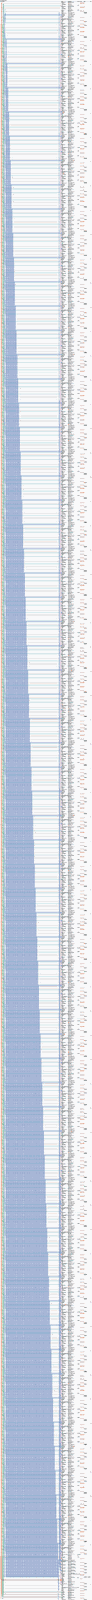
[diagram p0: system contents, whole]
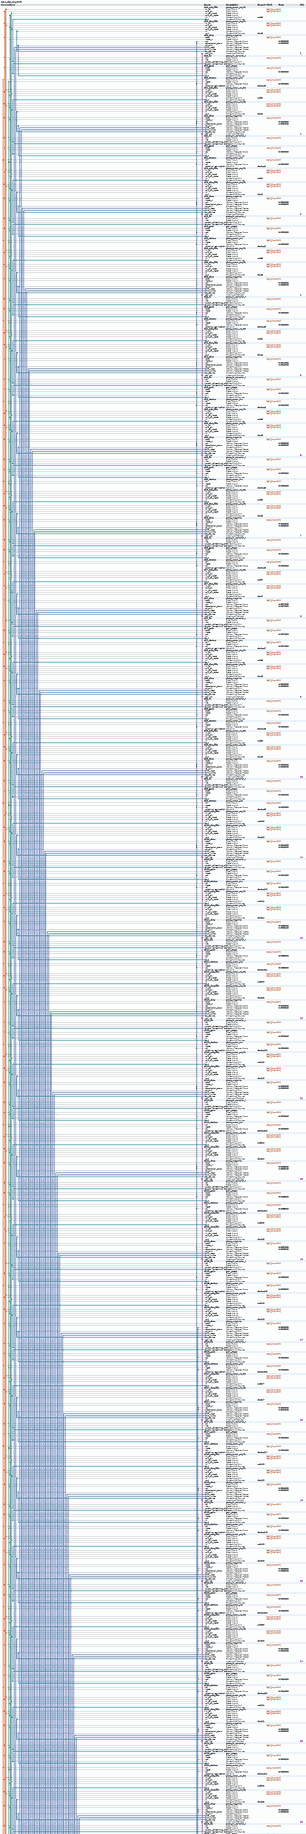
[diagram p1: system contents, upper part]
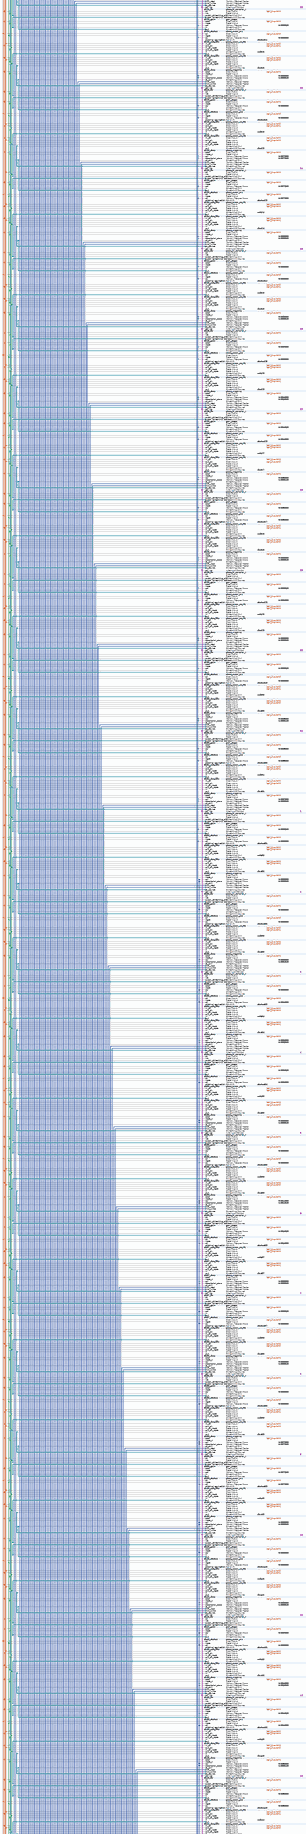
[diagram p2: system contents, middle part]
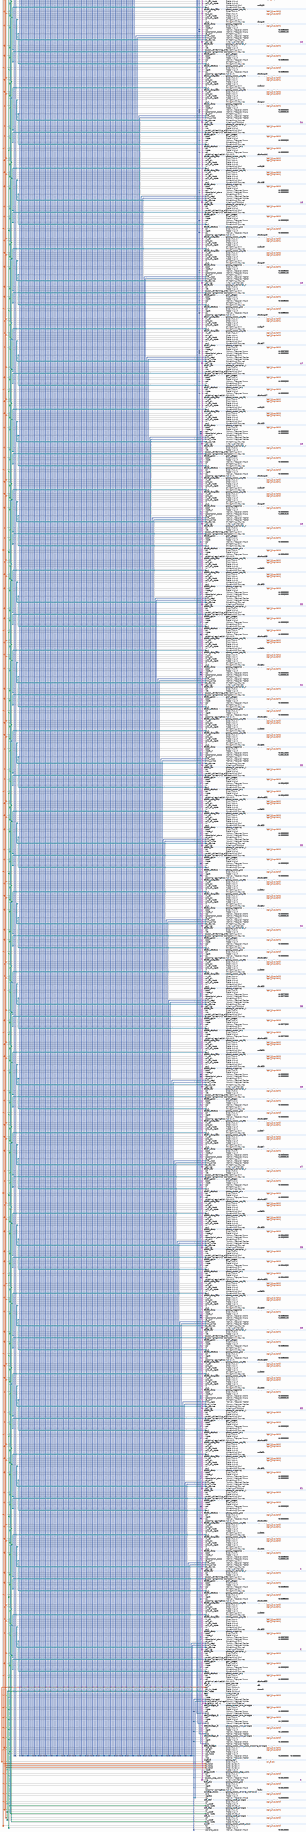
[diagram p3: system contents, lower part]
# Platform Designer (Qsys) system qsys_dsp_soc_64ch
# Parameters at their usual value, and those the tool derives, are not listed.
package require -exact qsys 23.1
create_system qsys_dsp_soc_64ch
set_project_property DEVICE_FAMILY {Agilex 7}

add_instance ch0_adc_fifo altera_avalon_dc_fifo 23.1
set_instance_parameter_value ch0_adc_fifo FIFO_DEPTH 512

add_instance ch0_dac_fifo altera_avalon_dc_fifo 23.1
set_instance_parameter_value ch0_dac_fifo FIFO_DEPTH 512

add_instance ch0_dma altera_msgdma 23.1
set_instance_parameter_value ch0_dma MODE 0
set_instance_parameter_value ch0_dma DATA_WIDTH 32

add_instance ch0_fir altera_fir_compiler_ii 23.1
set_instance_parameter_value ch0_fir inputBitWidth 16

add_instance ch0_gain gain_stage 1.0
set_instance_parameter_value ch0_gain GAIN_WIDTH 12

add_instance ch0_status altera_avalon_pio 23.1
set_instance_parameter_value ch0_status direction Input
set_instance_parameter_value ch0_status width 8

add_instance ch1_adc_fifo altera_avalon_dc_fifo 23.1
set_instance_parameter_value ch1_adc_fifo FIFO_DEPTH 512

add_instance ch1_dac_fifo altera_avalon_dc_fifo 23.1
set_instance_parameter_value ch1_dac_fifo FIFO_DEPTH 512

add_instance ch1_dma altera_msgdma 23.1
set_instance_parameter_value ch1_dma MODE 0
set_instance_parameter_value ch1_dma DATA_WIDTH 32

add_instance ch1_fir altera_fir_compiler_ii 23.1
set_instance_parameter_value ch1_fir inputBitWidth 16

add_instance ch1_gain gain_stage 1.0
set_instance_parameter_value ch1_gain GAIN_WIDTH 12

add_instance ch1_status altera_avalon_pio 23.1
set_instance_parameter_value ch1_status direction Input
set_instance_parameter_value ch1_status width 8

add_instance ch2_adc_fifo altera_avalon_dc_fifo 23.1
set_instance_parameter_value ch2_adc_fifo FIFO_DEPTH 512

add_instance ch2_dac_fifo altera_avalon_dc_fifo 23.1
set_instance_parameter_value ch2_dac_fifo FIFO_DEPTH 512

add_instance ch2_dma altera_msgdma 23.1
set_instance_parameter_value ch2_dma MODE 0
set_instance_parameter_value ch2_dma DATA_WIDTH 32

add_instance ch2_fir altera_fir_compiler_ii 23.1
set_instance_parameter_value ch2_fir inputBitWidth 16

add_instance ch2_gain gain_stage 1.0
set_instance_parameter_value ch2_gain GAIN_WIDTH 12

add_instance ch2_status altera_avalon_pio 23.1
set_instance_parameter_value ch2_status direction Input
set_instance_parameter_value ch2_status width 8

add_instance ch3_adc_fifo altera_avalon_dc_fifo 23.1
set_instance_parameter_value ch3_adc_fifo FIFO_DEPTH 512

add_instance ch3_dac_fifo altera_avalon_dc_fifo 23.1
set_instance_parameter_value ch3_dac_fifo FIFO_DEPTH 512

add_instance ch3_dma altera_msgdma 23.1
set_instance_parameter_value ch3_dma MODE 0
set_instance_parameter_value ch3_dma DATA_WIDTH 32

add_instance ch3_fir altera_fir_compiler_ii 23.1
set_instance_parameter_value ch3_fir inputBitWidth 16

add_instance ch3_gain gain_stage 1.0
set_instance_parameter_value ch3_gain GAIN_WIDTH 12

add_instance ch3_status altera_avalon_pio 23.1
set_instance_parameter_value ch3_status direction Input
set_instance_parameter_value ch3_status width 8

add_instance ch4_adc_fifo altera_avalon_dc_fifo 23.1
set_instance_parameter_value ch4_adc_fifo FIFO_DEPTH 512

add_instance ch4_dac_fifo altera_avalon_dc_fifo 23.1
set_instance_parameter_value ch4_dac_fifo FIFO_DEPTH 512

add_instance ch4_dma altera_msgdma 23.1
set_instance_parameter_value ch4_dma MODE 0
set_instance_parameter_value ch4_dma DATA_WIDTH 32

add_instance ch4_fir altera_fir_compiler_ii 23.1
set_instance_parameter_value ch4_fir inputBitWidth 16

add_instance ch4_gain gain_stage 1.0
set_instance_parameter_value ch4_gain GAIN_WIDTH 12

add_instance ch4_status altera_avalon_pio 23.1
set_instance_parameter_value ch4_status direction Input
set_instance_parameter_value ch4_status width 8

add_instance ch5_adc_fifo altera_avalon_dc_fifo 23.1
set_instance_parameter_value ch5_adc_fifo FIFO_DEPTH 512

add_instance ch5_dac_fifo altera_avalon_dc_fifo 23.1
set_instance_parameter_value ch5_dac_fifo FIFO_DEPTH 512

add_instance ch5_dma altera_msgdma 23.1
set_instance_parameter_value ch5_dma MODE 0
set_instance_parameter_value ch5_dma DATA_WIDTH 32

add_instance ch5_fir altera_fir_compiler_ii 23.1
set_instance_parameter_value ch5_fir inputBitWidth 16

add_instance ch5_gain gain_stage 1.0
set_instance_parameter_value ch5_gain GAIN_WIDTH 12

add_instance ch5_status altera_avalon_pio 23.1
set_instance_parameter_value ch5_status direction Input
set_instance_parameter_value ch5_status width 8

add_instance ch6_adc_fifo altera_avalon_dc_fifo 23.1
set_instance_parameter_value ch6_adc_fifo FIFO_DEPTH 512

add_instance ch6_dac_fifo altera_avalon_dc_fifo 23.1
set_instance_parameter_value ch6_dac_fifo FIFO_DEPTH 512

add_instance ch6_dma altera_msgdma 23.1
set_instance_parameter_value ch6_dma MODE 0
set_instance_parameter_value ch6_dma DATA_WIDTH 32

add_instance ch6_fir altera_fir_compiler_ii 23.1
set_instance_parameter_value ch6_fir inputBitWidth 16

add_instance ch6_gain gain_stage 1.0
set_instance_parameter_value ch6_gain GAIN_WIDTH 12

add_instance ch6_status altera_avalon_pio 23.1
set_instance_parameter_value ch6_status direction Input
set_instance_parameter_value ch6_status width 8

add_instance ch7_adc_fifo altera_avalon_dc_fifo 23.1
set_instance_parameter_value ch7_adc_fifo FIFO_DEPTH 512

add_instance ch7_dac_fifo altera_avalon_dc_fifo 23.1
set_instance_parameter_value ch7_dac_fifo FIFO_DEPTH 512

add_instance ch7_dma altera_msgdma 23.1
set_instance_parameter_value ch7_dma MODE 0
set_instance_parameter_value ch7_dma DATA_WIDTH 32

add_instance ch7_fir altera_fir_compiler_ii 23.1
set_instance_parameter_value ch7_fir inputBitWidth 16

add_instance ch7_gain gain_stage 1.0
set_instance_parameter_value ch7_gain GAIN_WIDTH 12

add_instance ch7_status altera_avalon_pio 23.1
set_instance_parameter_value ch7_status direction Input
set_instance_parameter_value ch7_status width 8

add_instance ch8_adc_fifo altera_avalon_dc_fifo 23.1
set_instance_parameter_value ch8_adc_fifo FIFO_DEPTH 512

add_instance ch8_dac_fifo altera_avalon_dc_fifo 23.1
set_instance_parameter_value ch8_dac_fifo FIFO_DEPTH 512

add_instance ch8_dma altera_msgdma 23.1
set_instance_parameter_value ch8_dma MODE 0
set_instance_parameter_value ch8_dma DATA_WIDTH 32

add_instance ch8_fir altera_fir_compiler_ii 23.1
set_instance_parameter_value ch8_fir inputBitWidth 16

add_instance ch8_gain gain_stage 1.0
set_instance_parameter_value ch8_gain GAIN_WIDTH 12

add_instance ch8_status altera_avalon_pio 23.1
set_instance_parameter_value ch8_status direction Input
set_instance_parameter_value ch8_status width 8

add_instance ch9_adc_fifo altera_avalon_dc_fifo 23.1
set_instance_parameter_value ch9_adc_fifo FIFO_DEPTH 512

add_instance ch9_dac_fifo altera_avalon_dc_fifo 23.1
set_instance_parameter_value ch9_dac_fifo FIFO_DEPTH 512

add_instance ch9_dma altera_msgdma 23.1
set_instance_parameter_value ch9_dma MODE 0
set_instance_parameter_value ch9_dma DATA_WIDTH 32

add_instance ch9_fir altera_fir_compiler_ii 23.1
set_instance_parameter_value ch9_fir inputBitWidth 16

add_instance ch9_gain gain_stage 1.0
set_instance_parameter_value ch9_gain GAIN_WIDTH 12

add_instance ch9_status altera_avalon_pio 23.1
set_instance_parameter_value ch9_status direction Input
set_instance_parameter_value ch9_status width 8

add_instance ch10_adc_fifo altera_avalon_dc_fifo 23.1
set_instance_parameter_value ch10_adc_fifo FIFO_DEPTH 512

add_instance ch10_dac_fifo altera_avalon_dc_fifo 23.1
set_instance_parameter_value ch10_dac_fifo FIFO_DEPTH 512

add_instance ch10_dma altera_msgdma 23.1
set_instance_parameter_value ch10_dma MODE 0
set_instance_parameter_value ch10_dma DATA_WIDTH 32

add_instance ch10_fir altera_fir_compiler_ii 23.1
set_instance_parameter_value ch10_fir inputBitWidth 16

add_instance ch10_gain gain_stage 1.0
set_instance_parameter_value ch10_gain GAIN_WIDTH 12

add_instance ch10_status altera_avalon_pio 23.1
set_instance_parameter_value ch10_status direction Input
set_instance_parameter_value ch10_status width 8

add_instance ch11_adc_fifo altera_avalon_dc_fifo 23.1
set_instance_parameter_value ch11_adc_fifo FIFO_DEPTH 512

add_instance ch11_dac_fifo altera_avalon_dc_fifo 23.1
set_instance_parameter_value ch11_dac_fifo FIFO_DEPTH 512

add_instance ch11_dma altera_msgdma 23.1
set_instance_parameter_value ch11_dma MODE 0
set_instance_parameter_value ch11_dma DATA_WIDTH 32

add_instance ch11_fir altera_fir_compiler_ii 23.1
set_instance_parameter_value ch11_fir inputBitWidth 16

add_instance ch11_gain gain_stage 1.0
set_instance_parameter_value ch11_gain GAIN_WIDTH 12

add_instance ch11_status altera_avalon_pio 23.1
set_instance_parameter_value ch11_status direction Input
set_instance_parameter_value ch11_status width 8

add_instance ch12_adc_fifo altera_avalon_dc_fifo 23.1
set_instance_parameter_value ch12_adc_fifo FIFO_DEPTH 512

add_instance ch12_dac_fifo altera_avalon_dc_fifo 23.1
set_instance_parameter_value ch12_dac_fifo FIFO_DEPTH 512

add_instance ch12_dma altera_msgdma 23.1
set_instance_parameter_value ch12_dma MODE 0
set_instance_parameter_value ch12_dma DATA_WIDTH 32

add_instance ch12_fir altera_fir_compiler_ii 23.1
set_instance_parameter_value ch12_fir inputBitWidth 16

add_instance ch12_gain gain_stage 1.0
set_instance_parameter_value ch12_gain GAIN_WIDTH 12

add_instance ch12_status altera_avalon_pio 23.1
set_instance_parameter_value ch12_status direction Input
set_instance_parameter_value ch12_status width 8

add_instance ch13_adc_fifo altera_avalon_dc_fifo 23.1
set_instance_parameter_value ch13_adc_fifo FIFO_DEPTH 512

add_instance ch13_dac_fifo altera_avalon_dc_fifo 23.1
set_instance_parameter_value ch13_dac_fifo FIFO_DEPTH 512

add_instance ch13_dma altera_msgdma 23.1
set_instance_parameter_value ch13_dma MODE 0
set_instance_parameter_value ch13_dma DATA_WIDTH 32

add_instance ch13_fir altera_fir_compiler_ii 23.1
set_instance_parameter_value ch13_fir inputBitWidth 16

add_instance ch13_gain gain_stage 1.0
set_instance_parameter_value ch13_gain GAIN_WIDTH 12

add_instance ch13_status altera_avalon_pio 23.1
set_instance_parameter_value ch13_status direction Input
set_instance_parameter_value ch13_status width 8

add_instance ch14_adc_fifo altera_avalon_dc_fifo 23.1
set_instance_parameter_value ch14_adc_fifo FIFO_DEPTH 512

add_instance ch14_dac_fifo altera_avalon_dc_fifo 23.1
set_instance_parameter_value ch14_dac_fifo FIFO_DEPTH 512

add_instance ch14_dma altera_msgdma 23.1
set_instance_parameter_value ch14_dma MODE 0
set_instance_parameter_value ch14_dma DATA_WIDTH 32

add_instance ch14_fir altera_fir_compiler_ii 23.1
set_instance_parameter_value ch14_fir inputBitWidth 16

add_instance ch14_gain gain_stage 1.0
set_instance_parameter_value ch14_gain GAIN_WIDTH 12

add_instance ch14_status altera_avalon_pio 23.1
set_instance_parameter_value ch14_status direction Input
set_instance_parameter_value ch14_status width 8

add_instance ch15_adc_fifo altera_avalon_dc_fifo 23.1
set_instance_parameter_value ch15_adc_fifo FIFO_DEPTH 512

add_instance ch15_dac_fifo altera_avalon_dc_fifo 23.1
set_instance_parameter_value ch15_dac_fifo FIFO_DEPTH 512

add_instance ch15_dma altera_msgdma 23.1
set_instance_parameter_value ch15_dma MODE 0
set_instance_parameter_value ch15_dma DATA_WIDTH 32

add_instance ch15_fir altera_fir_compiler_ii 23.1
set_instance_parameter_value ch15_fir inputBitWidth 16

add_instance ch15_gain gain_stage 1.0
set_instance_parameter_value ch15_gain GAIN_WIDTH 12

add_instance ch15_status altera_avalon_pio 23.1
set_instance_parameter_value ch15_status direction Input
set_instance_parameter_value ch15_status width 8

add_instance ch16_adc_fifo altera_avalon_dc_fifo 23.1
set_instance_parameter_value ch16_adc_fifo FIFO_DEPTH 512

add_instance ch16_dac_fifo altera_avalon_dc_fifo 23.1
set_instance_parameter_value ch16_dac_fifo FIFO_DEPTH 512

add_instance ch16_dma altera_msgdma 23.1
set_instance_parameter_value ch16_dma MODE 0
set_instance_parameter_value ch16_dma DATA_WIDTH 32

add_instance ch16_fir altera_fir_compiler_ii 23.1
set_instance_parameter_value ch16_fir inputBitWidth 16

add_instance ch16_gain gain_stage 1.0
set_instance_parameter_value ch16_gain GAIN_WIDTH 12

add_instance ch16_status altera_avalon_pio 23.1
set_instance_parameter_value ch16_status direction Input
set_instance_parameter_value ch16_status width 8

add_instance ch17_adc_fifo altera_avalon_dc_fifo 23.1
set_instance_parameter_value ch17_adc_fifo FIFO_DEPTH 512

add_instance ch17_dac_fifo altera_avalon_dc_fifo 23.1
set_instance_parameter_value ch17_dac_fifo FIFO_DEPTH 512

add_instance ch17_dma altera_msgdma 23.1
set_instance_parameter_value ch17_dma MODE 0
set_instance_parameter_value ch17_dma DATA_WIDTH 32

add_instance ch17_fir altera_fir_compiler_ii 23.1
set_instance_parameter_value ch17_fir inputBitWidth 16

add_instance ch17_gain gain_stage 1.0
set_instance_parameter_value ch17_gain GAIN_WIDTH 12

add_instance ch17_status altera_avalon_pio 23.1
set_instance_parameter_value ch17_status direction Input
set_instance_parameter_value ch17_status width 8

add_instance ch18_adc_fifo altera_avalon_dc_fifo 23.1
set_instance_parameter_value ch18_adc_fifo FIFO_DEPTH 512

add_instance ch18_dac_fifo altera_avalon_dc_fifo 23.1
set_instance_parameter_value ch18_dac_fifo FIFO_DEPTH 512

add_instance ch18_dma altera_msgdma 23.1
set_instance_parameter_value ch18_dma MODE 0
set_instance_parameter_value ch18_dma DATA_WIDTH 32

add_instance ch18_fir altera_fir_compiler_ii 23.1
set_instance_parameter_value ch18_fir inputBitWidth 16

add_instance ch18_gain gain_stage 1.0
set_instance_parameter_value ch18_gain GAIN_WIDTH 12

add_instance ch18_status altera_avalon_pio 23.1
set_instance_parameter_value ch18_status direction Input
set_instance_parameter_value ch18_status width 8

add_instance ch19_adc_fifo altera_avalon_dc_fifo 23.1
set_instance_parameter_value ch19_adc_fifo FIFO_DEPTH 512

add_instance ch19_dac_fifo altera_avalon_dc_fifo 23.1
set_instance_parameter_value ch19_dac_fifo FIFO_DEPTH 512

add_instance ch19_dma altera_msgdma 23.1
set_instance_parameter_value ch19_dma MODE 0
set_instance_parameter_value ch19_dma DATA_WIDTH 32

add_instance ch19_fir altera_fir_compiler_ii 23.1
set_instance_parameter_value ch19_fir inputBitWidth 16

add_instance ch19_gain gain_stage 1.0
set_instance_parameter_value ch19_gain GAIN_WIDTH 12

add_instance ch19_status altera_avalon_pio 23.1
set_instance_parameter_value ch19_status direction Input
set_instance_parameter_value ch19_status width 8

add_instance ch20_adc_fifo altera_avalon_dc_fifo 23.1
set_instance_parameter_value ch20_adc_fifo FIFO_DEPTH 512

add_instance ch20_dac_fifo altera_avalon_dc_fifo 23.1
set_instance_parameter_value ch20_dac_fifo FIFO_DEPTH 512

add_instance ch20_dma altera_msgdma 23.1
set_instance_parameter_value ch20_dma MODE 0
set_instance_parameter_value ch20_dma DATA_WIDTH 32

add_instance ch20_fir altera_fir_compiler_ii 23.1
set_instance_parameter_value ch20_fir inputBitWidth 16

add_instance ch20_gain gain_stage 1.0
set_instance_parameter_value ch20_gain GAIN_WIDTH 12

add_instance ch20_status altera_avalon_pio 23.1
set_instance_parameter_value ch20_status direction Input
set_instance_parameter_value ch20_status width 8

add_instance ch21_adc_fifo altera_avalon_dc_fifo 23.1
set_instance_parameter_value ch21_adc_fifo FIFO_DEPTH 512

add_instance ch21_dac_fifo altera_avalon_dc_fifo 23.1
set_instance_parameter_value ch21_dac_fifo FIFO_DEPTH 512

add_instance ch21_dma altera_msgdma 23.1
set_instance_parameter_value ch21_dma MODE 0
set_instance_parameter_value ch21_dma DATA_WIDTH 32

add_instance ch21_fir altera_fir_compiler_ii 23.1
set_instance_parameter_value ch21_fir inputBitWidth 16

add_instance ch21_gain gain_stage 1.0
set_instance_parameter_value ch21_gain GAIN_WIDTH 12

add_instance ch21_status altera_avalon_pio 23.1
set_instance_parameter_value ch21_status direction Input
set_instance_parameter_value ch21_status width 8

add_instance ch22_adc_fifo altera_avalon_dc_fifo 23.1
set_instance_parameter_value ch22_adc_fifo FIFO_DEPTH 512

add_instance ch22_dac_fifo altera_avalon_dc_fifo 23.1
set_instance_parameter_value ch22_dac_fifo FIFO_DEPTH 512

add_instance ch22_dma altera_msgdma 23.1
set_instance_parameter_value ch22_dma MODE 0
set_instance_parameter_value ch22_dma DATA_WIDTH 32

add_instance ch22_fir altera_fir_compiler_ii 23.1
set_instance_parameter_value ch22_fir inputBitWidth 16

add_instance ch22_gain gain_stage 1.0
set_instance_parameter_value ch22_gain GAIN_WIDTH 12

add_instance ch22_status altera_avalon_pio 23.1
set_instance_parameter_value ch22_status direction Input
set_instance_parameter_value ch22_status width 8

add_instance ch23_adc_fifo altera_avalon_dc_fifo 23.1
set_instance_parameter_value ch23_adc_fifo FIFO_DEPTH 512

add_instance ch23_dac_fifo altera_avalon_dc_fifo 23.1
set_instance_parameter_value ch23_dac_fifo FIFO_DEPTH 512

add_instance ch23_dma altera_msgdma 23.1
set_instance_parameter_value ch23_dma MODE 0
set_instance_parameter_value ch23_dma DATA_WIDTH 32

add_instance ch23_fir altera_fir_compiler_ii 23.1
set_instance_parameter_value ch23_fir inputBitWidth 16

add_instance ch23_gain gain_stage 1.0
set_instance_parameter_value ch23_gain GAIN_WIDTH 12

add_instance ch23_status altera_avalon_pio 23.1
set_instance_parameter_value ch23_status direction Input
set_instance_parameter_value ch23_status width 8

add_instance ch24_adc_fifo altera_avalon_dc_fifo 23.1
set_instance_parameter_value ch24_adc_fifo FIFO_DEPTH 512

add_instance ch24_dac_fifo altera_avalon_dc_fifo 23.1
set_instance_parameter_value ch24_dac_fifo FIFO_DEPTH 512

add_instance ch24_dma altera_msgdma 23.1
set_instance_parameter_value ch24_dma MODE 0
set_instance_parameter_value ch24_dma DATA_WIDTH 32

add_instance ch24_fir altera_fir_compiler_ii 23.1
set_instance_parameter_value ch24_fir inputBitWidth 16

add_instance ch24_gain gain_stage 1.0
set_instance_parameter_value ch24_gain GAIN_WIDTH 12

add_instance ch24_status altera_avalon_pio 23.1
set_instance_parameter_value ch24_status direction Input
set_instance_parameter_value ch24_status width 8

add_instance ch25_adc_fifo altera_avalon_dc_fifo 23.1
set_instance_parameter_value ch25_adc_fifo FIFO_DEPTH 512

add_instance ch25_dac_fifo altera_avalon_dc_fifo 23.1
set_instance_parameter_value ch25_dac_fifo FIFO_DEPTH 512

add_instance ch25_dma altera_msgdma 23.1
set_instance_parameter_value ch25_dma MODE 0
set_instance_parameter_value ch25_dma DATA_WIDTH 32

add_instance ch25_fir altera_fir_compiler_ii 23.1
set_instance_parameter_value ch25_fir inputBitWidth 16

add_instance ch25_gain gain_stage 1.0
set_instance_parameter_value ch25_gain GAIN_WIDTH 12

add_instance ch25_status altera_avalon_pio 23.1
set_instance_parameter_value ch25_status direction Input
set_instance_parameter_value ch25_status width 8

add_instance ch26_adc_fifo altera_avalon_dc_fifo 23.1
set_instance_parameter_value ch26_adc_fifo FIFO_DEPTH 512

add_instance ch26_dac_fifo altera_avalon_dc_fifo 23.1
set_instance_parameter_value ch26_dac_fifo FIFO_DEPTH 512

add_instance ch26_dma altera_msgdma 23.1
set_instance_parameter_value ch26_dma MODE 0
set_instance_parameter_value ch26_dma DATA_WIDTH 32

add_instance ch26_fir altera_fir_compiler_ii 23.1
set_instance_parameter_value ch26_fir inputBitWidth 16

add_instance ch26_gain gain_stage 1.0
set_instance_parameter_value ch26_gain GAIN_WIDTH 12

add_instance ch26_status altera_avalon_pio 23.1
set_instance_parameter_value ch26_status direction Input
set_instance_parameter_value ch26_status width 8

add_instance ch27_adc_fifo altera_avalon_dc_fifo 23.1
set_instance_parameter_value ch27_adc_fifo FIFO_DEPTH 512

add_instance ch27_dac_fifo altera_avalon_dc_fifo 23.1
set_instance_parameter_value ch27_dac_fifo FIFO_DEPTH 512

add_instance ch27_dma altera_msgdma 23.1
set_instance_parameter_value ch27_dma MODE 0
set_instance_parameter_value ch27_dma DATA_WIDTH 32

add_instance ch27_fir altera_fir_compiler_ii 23.1
set_instance_parameter_value ch27_fir inputBitWidth 16

add_instance ch27_gain gain_stage 1.0
set_instance_parameter_value ch27_gain GAIN_WIDTH 12

add_instance ch27_status altera_avalon_pio 23.1
set_instance_parameter_value ch27_status direction Input
set_instance_parameter_value ch27_status width 8

add_instance ch28_adc_fifo altera_avalon_dc_fifo 23.1
set_instance_parameter_value ch28_adc_fifo FIFO_DEPTH 512

add_instance ch28_dac_fifo altera_avalon_dc_fifo 23.1
set_instance_parameter_value ch28_dac_fifo FIFO_DEPTH 512

add_instance ch28_dma altera_msgdma 23.1
set_instance_parameter_value ch28_dma MODE 0
set_instance_parameter_value ch28_dma DATA_WIDTH 32

add_instance ch28_fir altera_fir_compiler_ii 23.1
set_instance_parameter_value ch28_fir inputBitWidth 16

add_instance ch28_gain gain_stage 1.0
set_instance_parameter_value ch28_gain GAIN_WIDTH 12

add_instance ch28_status altera_avalon_pio 23.1
set_instance_parameter_value ch28_status direction Input
set_instance_parameter_value ch28_status width 8

add_instance ch29_adc_fifo altera_avalon_dc_fifo 23.1
set_instance_parameter_value ch29_adc_fifo FIFO_DEPTH 512

add_instance ch29_dac_fifo altera_avalon_dc_fifo 23.1
set_instance_parameter_value ch29_dac_fifo FIFO_DEPTH 512

add_instance ch29_dma altera_msgdma 23.1
set_instance_parameter_value ch29_dma MODE 0
set_instance_parameter_value ch29_dma DATA_WIDTH 32

add_instance ch29_fir altera_fir_compiler_ii 23.1
set_instance_parameter_value ch29_fir inputBitWidth 16

add_instance ch29_gain gain_stage 1.0
set_instance_parameter_value ch29_gain GAIN_WIDTH 12

add_instance ch29_status altera_avalon_pio 23.1
set_instance_parameter_value ch29_status direction Input
set_instance_parameter_value ch29_status width 8

add_instance ch30_adc_fifo altera_avalon_dc_fifo 23.1
set_instance_parameter_value ch30_adc_fifo FIFO_DEPTH 512

add_instance ch30_dac_fifo altera_avalon_dc_fifo 23.1
set_instance_parameter_value ch30_dac_fifo FIFO_DEPTH 512

add_instance ch30_dma altera_msgdma 23.1
set_instance_parameter_value ch30_dma MODE 0
set_instance_parameter_value ch30_dma DATA_WIDTH 32

add_instance ch30_fir altera_fir_compiler_ii 23.1
set_instance_parameter_value ch30_fir inputBitWidth 16

add_instance ch30_gain gain_stage 1.0
set_instance_parameter_value ch30_gain GAIN_WIDTH 12

add_instance ch30_status altera_avalon_pio 23.1
set_instance_parameter_value ch30_status direction Input
set_instance_parameter_value ch30_status width 8

add_instance ch31_adc_fifo altera_avalon_dc_fifo 23.1
set_instance_parameter_value ch31_adc_fifo FIFO_DEPTH 512

add_instance ch31_dac_fifo altera_avalon_dc_fifo 23.1
set_instance_parameter_value ch31_dac_fifo FIFO_DEPTH 512

add_instance ch31_dma altera_msgdma 23.1
set_instance_parameter_value ch31_dma MODE 0
set_instance_parameter_value ch31_dma DATA_WIDTH 32

add_instance ch31_fir altera_fir_compiler_ii 23.1
set_instance_parameter_value ch31_fir inputBitWidth 16

add_instance ch31_gain gain_stage 1.0
set_instance_parameter_value ch31_gain GAIN_WIDTH 12

add_instance ch31_status altera_avalon_pio 23.1
set_instance_parameter_value ch31_status direction Input
set_instance_parameter_value ch31_status width 8

add_instance ch32_adc_fifo altera_avalon_dc_fifo 23.1
set_instance_parameter_value ch32_adc_fifo FIFO_DEPTH 512

add_instance ch32_dac_fifo altera_avalon_dc_fifo 23.1
set_instance_parameter_value ch32_dac_fifo FIFO_DEPTH 512

add_instance ch32_dma altera_msgdma 23.1
set_instance_parameter_value ch32_dma MODE 0
set_instance_parameter_value ch32_dma DATA_WIDTH 32

add_instance ch32_fir altera_fir_compiler_ii 23.1
set_instance_parameter_value ch32_fir inputBitWidth 16

add_instance ch32_gain gain_stage 1.0
set_instance_parameter_value ch32_gain GAIN_WIDTH 12

add_instance ch32_status altera_avalon_pio 23.1
set_instance_parameter_value ch32_status direction Input
set_instance_parameter_value ch32_status width 8

add_instance ch33_adc_fifo altera_avalon_dc_fifo 23.1
set_instance_parameter_value ch33_adc_fifo FIFO_DEPTH 512

add_instance ch33_dac_fifo altera_avalon_dc_fifo 23.1
set_instance_parameter_value ch33_dac_fifo FIFO_DEPTH 512

add_instance ch33_dma altera_msgdma 23.1
set_instance_parameter_value ch33_dma MODE 0
set_instance_parameter_value ch33_dma DATA_WIDTH 32

add_instance ch33_fir altera_fir_compiler_ii 23.1
set_instance_parameter_value ch33_fir inputBitWidth 16

add_instance ch33_gain gain_stage 1.0
set_instance_parameter_value ch33_gain GAIN_WIDTH 12

add_instance ch33_status altera_avalon_pio 23.1
set_instance_parameter_value ch33_status direction Input
set_instance_parameter_value ch33_status width 8

add_instance ch34_adc_fifo altera_avalon_dc_fifo 23.1
set_instance_parameter_value ch34_adc_fifo FIFO_DEPTH 512

add_instance ch34_dac_fifo altera_avalon_dc_fifo 23.1
set_instance_parameter_value ch34_dac_fifo FIFO_DEPTH 512

add_instance ch34_dma altera_msgdma 23.1
set_instance_parameter_value ch34_dma MODE 0
set_instance_parameter_value ch34_dma DATA_WIDTH 32

add_instance ch34_fir altera_fir_compiler_ii 23.1
set_instance_parameter_value ch34_fir inputBitWidth 16

add_instance ch34_gain gain_stage 1.0
set_instance_parameter_value ch34_gain GAIN_WIDTH 12

add_instance ch34_status altera_avalon_pio 23.1
set_instance_parameter_value ch34_status direction Input
set_instance_parameter_value ch34_status width 8

add_instance ch35_adc_fifo altera_avalon_dc_fifo 23.1
set_instance_parameter_value ch35_adc_fifo FIFO_DEPTH 512

add_instance ch35_dac_fifo altera_avalon_dc_fifo 23.1
set_instance_parameter_value ch35_dac_fifo FIFO_DEPTH 512

add_instance ch35_dma altera_msgdma 23.1
set_instance_parameter_value ch35_dma MODE 0
set_instance_parameter_value ch35_dma DATA_WIDTH 32

add_instance ch35_fir altera_fir_compiler_ii 23.1
set_instance_parameter_value ch35_fir inputBitWidth 16

add_instance ch35_gain gain_stage 1.0
set_instance_parameter_value ch35_gain GAIN_WIDTH 12

add_instance ch35_status altera_avalon_pio 23.1
set_instance_parameter_value ch35_status direction Input
set_instance_parameter_value ch35_status width 8

add_instance ch36_adc_fifo altera_avalon_dc_fifo 23.1
set_instance_parameter_value ch36_adc_fifo FIFO_DEPTH 512

add_instance ch36_dac_fifo altera_avalon_dc_fifo 23.1
set_instance_parameter_value ch36_dac_fifo FIFO_DEPTH 512

add_instance ch36_dma altera_msgdma 23.1
set_instance_parameter_value ch36_dma MODE 0
set_instance_parameter_value ch36_dma DATA_WIDTH 32

add_instance ch36_fir altera_fir_compiler_ii 23.1
set_instance_parameter_value ch36_fir inputBitWidth 16

add_instance ch36_gain gain_stage 1.0
set_instance_parameter_value ch36_gain GAIN_WIDTH 12

add_instance ch36_status altera_avalon_pio 23.1
set_instance_parameter_value ch36_status direction Input
set_instance_parameter_value ch36_status width 8

add_instance ch37_adc_fifo altera_avalon_dc_fifo 23.1
set_instance_parameter_value ch37_adc_fifo FIFO_DEPTH 512

add_instance ch37_dac_fifo altera_avalon_dc_fifo 23.1
set_instance_parameter_value ch37_dac_fifo FIFO_DEPTH 512

add_instance ch37_dma altera_msgdma 23.1
set_instance_parameter_value ch37_dma MODE 0
set_instance_parameter_value ch37_dma DATA_WIDTH 32

add_instance ch37_fir altera_fir_compiler_ii 23.1
set_instance_parameter_value ch37_fir inputBitWidth 16

add_instance ch37_gain gain_stage 1.0
set_instance_parameter_value ch37_gain GAIN_WIDTH 12

add_instance ch37_status altera_avalon_pio 23.1
set_instance_parameter_value ch37_status direction Input
set_instance_parameter_value ch37_status width 8

add_instance ch38_adc_fifo altera_avalon_dc_fifo 23.1
set_instance_parameter_value ch38_adc_fifo FIFO_DEPTH 512

add_instance ch38_dac_fifo altera_avalon_dc_fifo 23.1
set_instance_parameter_value ch38_dac_fifo FIFO_DEPTH 512

add_instance ch38_dma altera_msgdma 23.1
set_instance_parameter_value ch38_dma MODE 0
set_instance_parameter_value ch38_dma DATA_WIDTH 32

add_instance ch38_fir altera_fir_compiler_ii 23.1
set_instance_parameter_value ch38_fir inputBitWidth 16

add_instance ch38_gain gain_stage 1.0
set_instance_parameter_value ch38_gain GAIN_WIDTH 12

add_instance ch38_status altera_avalon_pio 23.1
set_instance_parameter_value ch38_status direction Input
set_instance_parameter_value ch38_status width 8

add_instance ch39_adc_fifo altera_avalon_dc_fifo 23.1
set_instance_parameter_value ch39_adc_fifo FIFO_DEPTH 512

add_instance ch39_dac_fifo altera_avalon_dc_fifo 23.1
set_instance_parameter_value ch39_dac_fifo FIFO_DEPTH 512

add_instance ch39_dma altera_msgdma 23.1
set_instance_parameter_value ch39_dma MODE 0
set_instance_parameter_value ch39_dma DATA_WIDTH 32

add_instance ch39_fir altera_fir_compiler_ii 23.1
set_instance_parameter_value ch39_fir inputBitWidth 16

add_instance ch39_gain gain_stage 1.0
set_instance_parameter_value ch39_gain GAIN_WIDTH 12

add_instance ch39_status altera_avalon_pio 23.1
set_instance_parameter_value ch39_status direction Input
set_instance_parameter_value ch39_status width 8

add_instance ch40_adc_fifo altera_avalon_dc_fifo 23.1
set_instance_parameter_value ch40_adc_fifo FIFO_DEPTH 512

add_instance ch40_dac_fifo altera_avalon_dc_fifo 23.1
set_instance_parameter_value ch40_dac_fifo FIFO_DEPTH 512

add_instance ch40_dma altera_msgdma 23.1
set_instance_parameter_value ch40_dma MODE 0
set_instance_parameter_value ch40_dma DATA_WIDTH 32

add_instance ch40_fir altera_fir_compiler_ii 23.1
set_instance_parameter_value ch40_fir inputBitWidth 16

add_instance ch40_gain gain_stage 1.0
set_instance_parameter_value ch40_gain GAIN_WIDTH 12

add_instance ch40_status altera_avalon_pio 23.1
set_instance_parameter_value ch40_status direction Input
set_instance_parameter_value ch40_status width 8

add_instance ch41_adc_fifo altera_avalon_dc_fifo 23.1
set_instance_parameter_value ch41_adc_fifo FIFO_DEPTH 512

add_instance ch41_dac_fifo altera_avalon_dc_fifo 23.1
set_instance_parameter_value ch41_dac_fifo FIFO_DEPTH 512

add_instance ch41_dma altera_msgdma 23.1
set_instance_parameter_value ch41_dma MODE 0
set_instance_parameter_value ch41_dma DATA_WIDTH 32

add_instance ch41_fir altera_fir_compiler_ii 23.1
set_instance_parameter_value ch41_fir inputBitWidth 16

add_instance ch41_gain gain_stage 1.0
set_instance_parameter_value ch41_gain GAIN_WIDTH 12

add_instance ch41_status altera_avalon_pio 23.1
set_instance_parameter_value ch41_status direction Input
set_instance_parameter_value ch41_status width 8

add_instance ch42_adc_fifo altera_avalon_dc_fifo 23.1
set_instance_parameter_value ch42_adc_fifo FIFO_DEPTH 512

add_instance ch42_dac_fifo altera_avalon_dc_fifo 23.1
set_instance_parameter_value ch42_dac_fifo FIFO_DEPTH 512

add_instance ch42_dma altera_msgdma 23.1
set_instance_parameter_value ch42_dma MODE 0
set_instance_parameter_value ch42_dma DATA_WIDTH 32

add_instance ch42_fir altera_fir_compiler_ii 23.1
set_instance_parameter_value ch42_fir inputBitWidth 16

add_instance ch42_gain gain_stage 1.0
set_instance_parameter_value ch42_gain GAIN_WIDTH 12

add_instance ch42_status altera_avalon_pio 23.1
set_instance_parameter_value ch42_status direction Input
set_instance_parameter_value ch42_status width 8

add_instance ch43_adc_fifo altera_avalon_dc_fifo 23.1
set_instance_parameter_value ch43_adc_fifo FIFO_DEPTH 512

add_instance ch43_dac_fifo altera_avalon_dc_fifo 23.1
set_instance_parameter_value ch43_dac_fifo FIFO_DEPTH 512

add_instance ch43_dma altera_msgdma 23.1
set_instance_parameter_value ch43_dma MODE 0
set_instance_parameter_value ch43_dma DATA_WIDTH 32

add_instance ch43_fir altera_fir_compiler_ii 23.1
set_instance_parameter_value ch43_fir inputBitWidth 16

add_instance ch43_gain gain_stage 1.0
set_instance_parameter_value ch43_gain GAIN_WIDTH 12

add_instance ch43_status altera_avalon_pio 23.1
set_instance_parameter_value ch43_status direction Input
set_instance_parameter_value ch43_status width 8

add_instance ch44_adc_fifo altera_avalon_dc_fifo 23.1
set_instance_parameter_value ch44_adc_fifo FIFO_DEPTH 512

add_instance ch44_dac_fifo altera_avalon_dc_fifo 23.1
set_instance_parameter_value ch44_dac_fifo FIFO_DEPTH 512

add_instance ch44_dma altera_msgdma 23.1
set_instance_parameter_value ch44_dma MODE 0
set_instance_parameter_value ch44_dma DATA_WIDTH 32

add_instance ch44_fir altera_fir_compiler_ii 23.1
set_instance_parameter_value ch44_fir inputBitWidth 16

add_instance ch44_gain gain_stage 1.0
set_instance_parameter_value ch44_gain GAIN_WIDTH 12

add_instance ch44_status altera_avalon_pio 23.1
set_instance_parameter_value ch44_status direction Input
set_instance_parameter_value ch44_status width 8

add_instance ch45_adc_fifo altera_avalon_dc_fifo 23.1
set_instance_parameter_value ch45_adc_fifo FIFO_DEPTH 512

add_instance ch45_dac_fifo altera_avalon_dc_fifo 23.1
set_instance_parameter_value ch45_dac_fifo FIFO_DEPTH 512

add_instance ch45_dma altera_msgdma 23.1
set_instance_parameter_value ch45_dma MODE 0
set_instance_parameter_value ch45_dma DATA_WIDTH 32

add_instance ch45_fir altera_fir_compiler_ii 23.1
set_instance_parameter_value ch45_fir inputBitWidth 16

add_instance ch45_gain gain_stage 1.0
set_instance_parameter_value ch45_gain GAIN_WIDTH 12

add_instance ch45_status altera_avalon_pio 23.1
set_instance_parameter_value ch45_status direction Input
set_instance_parameter_value ch45_status width 8

add_instance ch46_adc_fifo altera_avalon_dc_fifo 23.1
set_instance_parameter_value ch46_adc_fifo FIFO_DEPTH 512

add_instance ch46_dac_fifo altera_avalon_dc_fifo 23.1
set_instance_parameter_value ch46_dac_fifo FIFO_DEPTH 512

add_instance ch46_dma altera_msgdma 23.1
set_instance_parameter_value ch46_dma MODE 0
set_instance_parameter_value ch46_dma DATA_WIDTH 32

add_instance ch46_fir altera_fir_compiler_ii 23.1
set_instance_parameter_value ch46_fir inputBitWidth 16

add_instance ch46_gain gain_stage 1.0
set_instance_parameter_value ch46_gain GAIN_WIDTH 12

add_instance ch46_status altera_avalon_pio 23.1
set_instance_parameter_value ch46_status direction Input
set_instance_parameter_value ch46_status width 8

add_instance ch47_adc_fifo altera_avalon_dc_fifo 23.1
set_instance_parameter_value ch47_adc_fifo FIFO_DEPTH 512

add_instance ch47_dac_fifo altera_avalon_dc_fifo 23.1
set_instance_parameter_value ch47_dac_fifo FIFO_DEPTH 512

add_instance ch47_dma altera_msgdma 23.1
set_instance_parameter_value ch47_dma MODE 0
set_instance_parameter_value ch47_dma DATA_WIDTH 32

add_instance ch47_fir altera_fir_compiler_ii 23.1
set_instance_parameter_value ch47_fir inputBitWidth 16

add_instance ch47_gain gain_stage 1.0
set_instance_parameter_value ch47_gain GAIN_WIDTH 12

add_instance ch47_status altera_avalon_pio 23.1
set_instance_parameter_value ch47_status direction Input
set_instance_parameter_value ch47_status width 8

add_instance ch48_adc_fifo altera_avalon_dc_fifo 23.1
set_instance_parameter_value ch48_adc_fifo FIFO_DEPTH 512

add_instance ch48_dac_fifo altera_avalon_dc_fifo 23.1
set_instance_parameter_value ch48_dac_fifo FIFO_DEPTH 512

add_instance ch48_dma altera_msgdma 23.1
set_instance_parameter_value ch48_dma MODE 0
set_instance_parameter_value ch48_dma DATA_WIDTH 32

add_instance ch48_fir altera_fir_compiler_ii 23.1
set_instance_parameter_value ch48_fir inputBitWidth 16

add_instance ch48_gain gain_stage 1.0
set_instance_parameter_value ch48_gain GAIN_WIDTH 12

add_instance ch48_status altera_avalon_pio 23.1
set_instance_parameter_value ch48_status direction Input
set_instance_parameter_value ch48_status width 8

add_instance ch49_adc_fifo altera_avalon_dc_fifo 23.1
set_instance_parameter_value ch49_adc_fifo FIFO_DEPTH 512

add_instance ch49_dac_fifo altera_avalon_dc_fifo 23.1
set_instance_parameter_value ch49_dac_fifo FIFO_DEPTH 512

add_instance ch49_dma altera_msgdma 23.1
set_instance_parameter_value ch49_dma MODE 0
set_instance_parameter_value ch49_dma DATA_WIDTH 32

add_instance ch49_fir altera_fir_compiler_ii 23.1
set_instance_parameter_value ch49_fir inputBitWidth 16

add_instance ch49_gain gain_stage 1.0
set_instance_parameter_value ch49_gain GAIN_WIDTH 12

add_instance ch49_status altera_avalon_pio 23.1
set_instance_parameter_value ch49_status direction Input
set_instance_parameter_value ch49_status width 8

add_instance ch50_adc_fifo altera_avalon_dc_fifo 23.1
set_instance_parameter_value ch50_adc_fifo FIFO_DEPTH 512

add_instance ch50_dac_fifo altera_avalon_dc_fifo 23.1
set_instance_parameter_value ch50_dac_fifo FIFO_DEPTH 512

add_instance ch50_dma altera_msgdma 23.1
set_instance_parameter_value ch50_dma MODE 0
set_instance_parameter_value ch50_dma DATA_WIDTH 32

add_instance ch50_fir altera_fir_compiler_ii 23.1
set_instance_parameter_value ch50_fir inputBitWidth 16

add_instance ch50_gain gain_stage 1.0
set_instance_parameter_value ch50_gain GAIN_WIDTH 12

add_instance ch50_status altera_avalon_pio 23.1
set_instance_parameter_value ch50_status direction Input
set_instance_parameter_value ch50_status width 8

add_instance ch51_adc_fifo altera_avalon_dc_fifo 23.1
set_instance_parameter_value ch51_adc_fifo FIFO_DEPTH 512

add_instance ch51_dac_fifo altera_avalon_dc_fifo 23.1
set_instance_parameter_value ch51_dac_fifo FIFO_DEPTH 512

add_instance ch51_dma altera_msgdma 23.1
set_instance_parameter_value ch51_dma MODE 0
set_instance_parameter_value ch51_dma DATA_WIDTH 32

add_instance ch51_fir altera_fir_compiler_ii 23.1
set_instance_parameter_value ch51_fir inputBitWidth 16

add_instance ch51_gain gain_stage 1.0
set_instance_parameter_value ch51_gain GAIN_WIDTH 12

add_instance ch51_status altera_avalon_pio 23.1
set_instance_parameter_value ch51_status direction Input
set_instance_parameter_value ch51_status width 8

add_instance ch52_adc_fifo altera_avalon_dc_fifo 23.1
set_instance_parameter_value ch52_adc_fifo FIFO_DEPTH 512

add_instance ch52_dac_fifo altera_avalon_dc_fifo 23.1
set_instance_parameter_value ch52_dac_fifo FIFO_DEPTH 512

add_instance ch52_dma altera_msgdma 23.1
set_instance_parameter_value ch52_dma MODE 0
set_instance_parameter_value ch52_dma DATA_WIDTH 32

add_instance ch52_fir altera_fir_compiler_ii 23.1
set_instance_parameter_value ch52_fir inputBitWidth 16

add_instance ch52_gain gain_stage 1.0
set_instance_parameter_value ch52_gain GAIN_WIDTH 12

add_instance ch52_status altera_avalon_pio 23.1
set_instance_parameter_value ch52_status direction Input
set_instance_parameter_value ch52_status width 8

add_instance ch53_adc_fifo altera_avalon_dc_fifo 23.1
set_instance_parameter_value ch53_adc_fifo FIFO_DEPTH 512

add_instance ch53_dac_fifo altera_avalon_dc_fifo 23.1
set_instance_parameter_value ch53_dac_fifo FIFO_DEPTH 512

add_instance ch53_dma altera_msgdma 23.1
set_instance_parameter_value ch53_dma MODE 0
set_instance_parameter_value ch53_dma DATA_WIDTH 32

add_instance ch53_fir altera_fir_compiler_ii 23.1
set_instance_parameter_value ch53_fir inputBitWidth 16

add_instance ch53_gain gain_stage 1.0
set_instance_parameter_value ch53_gain GAIN_WIDTH 12

add_instance ch53_status altera_avalon_pio 23.1
set_instance_parameter_value ch53_status direction Input
set_instance_parameter_value ch53_status width 8

add_instance ch54_adc_fifo altera_avalon_dc_fifo 23.1
set_instance_parameter_value ch54_adc_fifo FIFO_DEPTH 512

add_instance ch54_dac_fifo altera_avalon_dc_fifo 23.1
set_instance_parameter_value ch54_dac_fifo FIFO_DEPTH 512

add_instance ch54_dma altera_msgdma 23.1
set_instance_parameter_value ch54_dma MODE 0
set_instance_parameter_value ch54_dma DATA_WIDTH 32

add_instance ch54_fir altera_fir_compiler_ii 23.1
set_instance_parameter_value ch54_fir inputBitWidth 16

add_instance ch54_gain gain_stage 1.0
set_instance_parameter_value ch54_gain GAIN_WIDTH 12

add_instance ch54_status altera_avalon_pio 23.1
set_instance_parameter_value ch54_status direction Input
set_instance_parameter_value ch54_status width 8

add_instance ch55_adc_fifo altera_avalon_dc_fifo 23.1
set_instance_parameter_value ch55_adc_fifo FIFO_DEPTH 512

add_instance ch55_dac_fifo altera_avalon_dc_fifo 23.1
set_instance_parameter_value ch55_dac_fifo FIFO_DEPTH 512

add_instance ch55_dma altera_msgdma 23.1
set_instance_parameter_value ch55_dma MODE 0
set_instance_parameter_value ch55_dma DATA_WIDTH 32

add_instance ch55_fir altera_fir_compiler_ii 23.1
set_instance_parameter_value ch55_fir inputBitWidth 16

add_instance ch55_gain gain_stage 1.0
set_instance_parameter_value ch55_gain GAIN_WIDTH 12

add_instance ch55_status altera_avalon_pio 23.1
set_instance_parameter_value ch55_status direction Input
set_instance_parameter_value ch55_status width 8

add_instance ch56_adc_fifo altera_avalon_dc_fifo 23.1
set_instance_parameter_value ch56_adc_fifo FIFO_DEPTH 512

add_instance ch56_dac_fifo altera_avalon_dc_fifo 23.1
set_instance_parameter_value ch56_dac_fifo FIFO_DEPTH 512

add_instance ch56_dma altera_msgdma 23.1
set_instance_parameter_value ch56_dma MODE 0
set_instance_parameter_value ch56_dma DATA_WIDTH 32

add_instance ch56_fir altera_fir_compiler_ii 23.1
set_instance_parameter_value ch56_fir inputBitWidth 16

add_instance ch56_gain gain_stage 1.0
set_instance_parameter_value ch56_gain GAIN_WIDTH 12

add_instance ch56_status altera_avalon_pio 23.1
set_instance_parameter_value ch56_status direction Input
set_instance_parameter_value ch56_status width 8

add_instance ch57_adc_fifo altera_avalon_dc_fifo 23.1
set_instance_parameter_value ch57_adc_fifo FIFO_DEPTH 512

add_instance ch57_dac_fifo altera_avalon_dc_fifo 23.1
set_instance_parameter_value ch57_dac_fifo FIFO_DEPTH 512

add_instance ch57_dma altera_msgdma 23.1
set_instance_parameter_value ch57_dma MODE 0
set_instance_parameter_value ch57_dma DATA_WIDTH 32

add_instance ch57_fir altera_fir_compiler_ii 23.1
set_instance_parameter_value ch57_fir inputBitWidth 16

add_instance ch57_gain gain_stage 1.0
set_instance_parameter_value ch57_gain GAIN_WIDTH 12

add_instance ch57_status altera_avalon_pio 23.1
set_instance_parameter_value ch57_status direction Input
set_instance_parameter_value ch57_status width 8

add_instance ch58_adc_fifo altera_avalon_dc_fifo 23.1
set_instance_parameter_value ch58_adc_fifo FIFO_DEPTH 512

add_instance ch58_dac_fifo altera_avalon_dc_fifo 23.1
set_instance_parameter_value ch58_dac_fifo FIFO_DEPTH 512

add_instance ch58_dma altera_msgdma 23.1
set_instance_parameter_value ch58_dma MODE 0
set_instance_parameter_value ch58_dma DATA_WIDTH 32

add_instance ch58_fir altera_fir_compiler_ii 23.1
set_instance_parameter_value ch58_fir inputBitWidth 16

add_instance ch58_gain gain_stage 1.0
set_instance_parameter_value ch58_gain GAIN_WIDTH 12

add_instance ch58_status altera_avalon_pio 23.1
set_instance_parameter_value ch58_status direction Input
set_instance_parameter_value ch58_status width 8
